# Altium schematic sheet Power_supply.SchDoc
size A3; SheetNumber: 1; SheetTotal: 1; SPICEModelCacheNLVBOJOE: <root> / <DocumentId>NLVBOJOE</DocumentId> / </root>
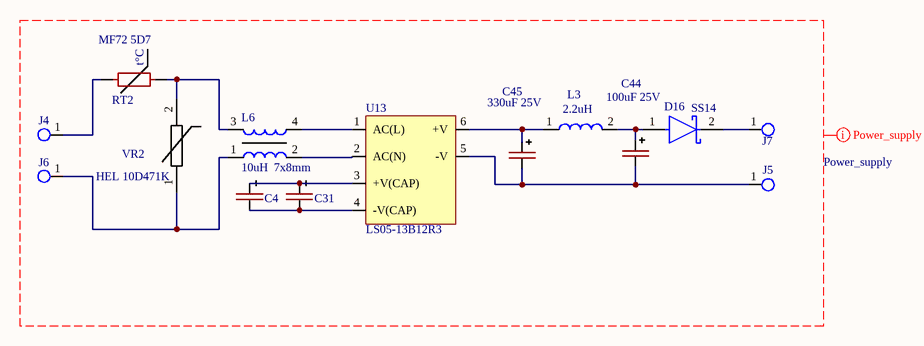
[diagram p0: Power_supply.SchDoc]

## Parts
C4  6.8uF 450V  [CAPPOL_10x13]  (value not drawn)
C31  6.8uF 450V  [CAPPOL_10x13]  (value not drawn)
C44  100uF 25V  [CAP_A765EB_KEM-L]
C45  330uF 25V  [CAP_A765EB_KEM-L]
D16  SS14  [DO-214-AC]
J4  Pad_CONN 3.5mm  [Pad_conn_3.5x5mm]  (value not drawn)
J5  Pad_CONN 3.5mm  [Pad_conn_3.5x5mm]  (value not drawn)
J6  Pad_CONN 3.5mm  [Pad_conn_3.5x5mm]  (value not drawn)
J7  Pad_CONN 3.5mm  [Pad_conn_3.5x5mm]  (value not drawn)
L3  2.2uH  [Coil_4.5x4.5_mm]
L6  10uH  7x8mm  [Common Mode Choke Inductor  30mH]
RT2  MF72 5D7  [MF72 XD-7]
U13  LS05-13B12R3  [YLPTEC LS05-13B12R3]
VR2  HEL 10D471K  [HEL_7D561K]

## Nets
NetC4_1: C4.1(+) C31.1(+) U13.3(+V(CAP))
NetC4_2: C4.2(-) C31.2(-) U13.4(-V(CAP))
NetC44_1: C44.1(+) D16.1(A) L3.2
NetC44_2: C44.2(-) C45.2(-) J5.1 U13.5(-V)
NetC45_1: C45.1(+) L3.1 U13.6(+V)
NetD16_2: D16.2(C) J7.1
NetJ4_1: J4.1 RT2.2
NetJ6_1: J6.1 L6.1 VR2.1
NetL6_2: L6.2 U13.2(AC(N))
NetL6_3: L6.3 RT2.1 VR2.2
NetL6_4: L6.4 U13.1(AC(L))

## Layout directives
CompClassName: Power_supply: (no net found under the mark)

## Notes on the sheet
- (in symbol RES-TEMP) t°C

## Library data of the parts
C4 C31 = CAP-POLAR: 6.8uF 450V LOW ESR
C44 = CAP_POL_SMD: 100uF 25V SMD,D6.3xL5.4mm  RST100UF25V004​ / KNSCHA
C45 = CAP_POL_SMD: 330uF 25V SMD,D6.3xL7.7mm  KNSCHA
J4-J7 = Klema_15_A
L3 = Coil: 2.2uH 3A / 40mΩMAX  MPS MPL-AL4020-2R2
L6 = Drossel_Synphaze: 10uH  UU9.8 Common Mode Choke Inductor / https://www.aliexpress.com/item/1005010443177841.html?spm=a2g0o.productlist.main.2.581f7bb894iQm9&algo_pvid=ef88ecc3-47f4-4459-8795-a7f2bc477caf&algo_exp_id=ef88ecc3-47f4-4459-8795-a7f2bc477caf-1&pdp_ext_f=%7B%22order%22%3A%22121%22%2C%22spu_best_type%22%3A%22price%22%2C%22eval%22%3A%221%22%2C%22fromPage%22%3A%22search%22%7D&pdp_npi=6%40dis%21UAH%21205.26%2196.09%21%21%2127.70%2112.97%21%402103973d17954349978863633e10a8%2112000052425269179%21sea%21UA%214339914066%21X%211%210%21n_tag%3A-29919%3Bd%3A9b83968a%3Bm03_new_user%3A-29895&curPageLogUid=TjiBi6yV6N5C&utparam-url=scene%3Asearch%7Cquery_from%3A%7Cx_object_id%3A1005010443177841%7C_p_origin_prod%3A
RT2 = RES-TEMP
VR2 = MOV: Metal Oxide Varistor  HEL 10D471K